# Altium project Phone_Charger.PrjPcb (part 3 of 3)

## Sheet DCDC_Conv_Section.SchDoc
size A4; DocumentNumber: 5; SheetNumber: 5; SheetTotal: 8
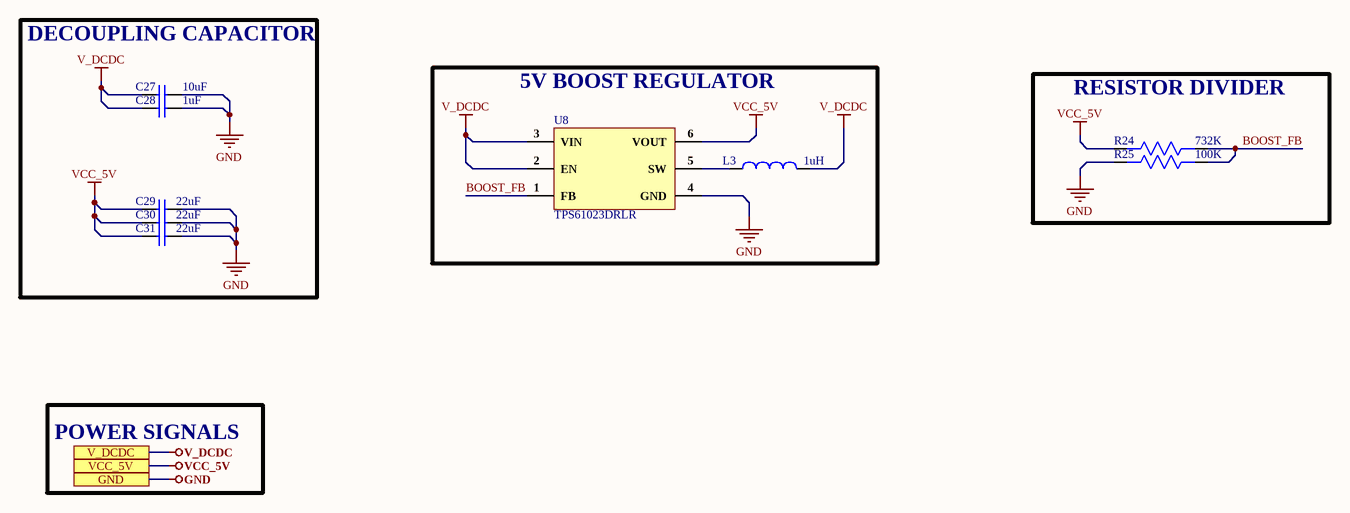
[diagram p6: DCDC_Conv_Section.SchDoc]

### Parts
C27  10uF  [Cap0603]
C28  1uF  [Cap0603]
C29  22uF  [Cap0805]
C30  22uF  [Cap0805]
C31  22uF  [Cap0805]
L3  1uH  [1239AS-H-1R0M=P2]
R24  732K  [Res0603]
R25  100K  [Res0603]
U8  TPS61023DRLR  [TPS61023DRLR]

### Blocks framed on the sheet
DECOUPLING CAPACITOR: C27-C31
5V BOOST REGULATOR: L3 U8
RESISTOR DIVIDER: R24 R25

### Ports
GND, V_DCDC, VCC_5V

### Nets
GND: C27.2 C28.2 C29.2 C30.2 C31.2 R25.2 U8.4(GND) ; port GND
V_DCDC: C27.1 C28.1 L3.2 U8.2(EN) U8.3(VIN) ; port V_DCDC
VCC_5V: C29.1 C30.1 C31.1 R24.2 U8.6(VOUT) ; port VCC_5V
BOOST_FB: R24.1 R25.1 U8.1(FB)
NetL3_1: L3.1 U8.5(SW)

### Notes on the sheet
- POWER SIGNALS

### Library data of the parts
C27 = CC0603MRX5R8BB106: CAP CER 10UF 25V X5R 0603; Manufacturer: Yageo; Tolerance: 20%; ComponentLink1URL: http://www.yageo.com/documents/recent/UPY-GPHC_Y5V_6.3V-to-50V_8.pdf?src-supplier=Digi-Key; ComponentLink1Description: http://www.yageo.com/documents/recent/UPY-GPHC_Y5V_6.3V-to-50V_8.pdf?src-supplier=Digi-Key; ComponentLink2URL: http://www.yageo.com/documents/recent/UPY-GPHC_Y5V_6.3V-to-50V_5.pdf?src-supplier=Avnet+Europe; ComponentLink2Description: http://www.yageo.com/documents/recent/UPY-GPHC_Y5V_6.3V-to-50V_5.pdf?src-supplier=Avnet+Europe; ComponentLink3URL: https://www.verical.com/server-webapp/html/getDatasheet?partID=403611&src-supplier=Verical; ComponentLink3Description: https://www.verical.com/server-webapp/html/getDatasheet?partID=403611&src-supplier=Verical; ComponentLink4URL: http://www.mouser.com/ds/2/447/Yageo_UPY-GP_NP0_16V-to-50V_9-358835.pdf?src-supplier=Mouser; ComponentLink4Description: http://www.mouser.com/ds/2/447/Yageo_UPY-GP_NP0_16V-to-50V_9-358835.pdf?src-supplier=Mouser; ComponentLink5URL: http://www.farnell.com/datasheets/1132289.pdf?src-supplier=Element14; ComponentLink5Description: http://www.farnell.com/datasheets/1132289.pdf?src-supplier=Element14; Supplier 1: Digi-Key; Manufacturer Part Number: CC0603MRX5R8BB106; Stock 1: 0; Pricing 1: 1=0.77, 10=0.568, 50=0.4542, 100=0.3893, 500=0.3082, 1000=0.2595 (USD); Mount: Surface Mount; Case/Package: 0603; Case Code (Imperial): 0603; Case Code (Metric): 1608; Min Operating Temperature: -55°C; Max Operating Temperature: 85°C; Packaging: Cut Tape; Capacitance: 10uF; Voltage Rating: 25V; RoHS Compliant: Yes; ComponentLink6URL: https://www.yageo.com/upload/media/product/productsearch/datasheet/mlcc/UPY-GPHC_X5R_4V-to-50V_26.pdf?src-supplier=Digi-Key; ComponentLink6Description: https://www.yageo.com/upload/media/product/productsearch/datasheet/mlcc/UPY-GPHC_X5R_4V-to-50V_26.pdf?src-supplier=Digi-Key; Supplier Part Number 1: 311-3494-6-ND
C28 = CC0603ZRY5V8BB105: CAP CER 1UF 25V Y5V 0603; Manufacturer: Yageo; Tolerance: 80%; ComponentLink1URL: http://www.yageo.com/documents/recent/UPY-GPHC_Y5V_6.3V-to-50V_8.pdf?src-supplier=Digi-Key; ComponentLink1Description: http://www.yageo.com/documents/recent/UPY-GPHC_Y5V_6.3V-to-50V_8.pdf?src-supplier=Digi-Key; ComponentLink2URL: http://www.yageo.com/documents/recent/UPY-GPHC_Y5V_6.3V-to-50V_5.pdf?src-supplier=Avnet+Europe; ComponentLink2Description: http://www.yageo.com/documents/recent/UPY-GPHC_Y5V_6.3V-to-50V_5.pdf?src-supplier=Avnet+Europe; ComponentLink3URL: https://www.verical.com/server-webapp/html/getDatasheet?partID=403611&src-supplier=Verical; ComponentLink3Description: https://www.verical.com/server-webapp/html/getDatasheet?partID=403611&src-supplier=Verical; ComponentLink4URL: http://www.mouser.com/ds/2/447/Yageo_UPY-GP_NP0_16V-to-50V_9-358835.pdf?src-supplier=Mouser; ComponentLink4Description: http://www.mouser.com/ds/2/447/Yageo_UPY-GP_NP0_16V-to-50V_9-358835.pdf?src-supplier=Mouser; ComponentLink5URL: http://www.farnell.com/datasheets/1132289.pdf?src-supplier=Element14; ComponentLink5Description: http://www.farnell.com/datasheets/1132289.pdf?src-supplier=Element14; Supplier 1: Digi-Key; Manufacturer Part Number: CC0603ZRY5V8BB105; Stock 1: 82432; Pricing 1: 1=0.13, 10=0.096, 50=0.0544, 100=0.045, 500=0.0316, 1000=0.0261 (USD); Mount: Surface Mount; Case/Package: 0603; Case Code (Imperial): 0603; Case Code (Metric): 1608; Min Operating Temperature: -30°C; Max Operating Temperature: 85°C; Voltage Rating (DC): 25V; Packaging: Tape and Reel; Capacitance: 1uF; Voltage Rating: 25V; Dielectric: Y5V; Termination: SMD/SMT; Resistor Type: Ceramic; Series: CC; Length: 0.063inch; Width: 0.031inch; Height: 0.8mm; Thickness: 0.035inch; Lead Free: Lead Free; Halogen Free: Halogen Free; RoHS Compliant: Yes; Supplier Part Number 1: 311-1829-1-ND
C29-C31 = C2012X5R1V226MT000E: CAP CER 22UF 35V X5R 0805
L3 = 1239AS-H-1R0M=P2: 3A 1uH ±20% 59mΩ 1008 Inductors (SMD) ROHS
R24 = AC0603FR-07732KL: RES SMD 732kOhm 1% 0603; Manufacturer: Yageo; Power Rating: 100mW; Resistance: 732kR; Voltage Rating: 50V; Temperature Coefficient: 100ppm/°C; Supplier 1: Mouser; Manufacturer Part Number: AC0603FR-07732KL; RoHS: Yes; Category: Chip SMD Resistors; Stock 1: 40000; Pricing 1: 1=0.10000, 10=0.02200, 50=0.02200, 100=0.00800, 1000=0.00600, 10000=0.00400 (USD); Case/Package: 0603; Case Code (Imperial): 0603; Case Code (Metric): 1608; Min Operating Temperature: -55°C; Max Operating Temperature: 155°C; Packaging: Tape and Reel; Tolerance: 1%; Resistor Type: Thick Film; Number of Terminations: 2; Termination: SMD/SMT; Max Power Dissipation: 100mW; Features: Moisture Resistant,Automotive AEC-Q200; Series: AC; Length: 0.063inch; Width: 0.031inch; Height: 0.022inch; RoHS Compliant: Yes; ComponentLink1URL: http://www.mouser.com/ds/2/447/yageodocoutput-1111992.pdf?src-supplier=Mouser; ComponentLink1Description: http://www.mouser.com/ds/2/447/yageodocoutput-1111992.pdf?src-supplier=Mouser; ComponentLink2URL: http://www.yageo.com/NewPortal/yageodocoutput?fileName=/pdf/R-Chip/PYu-AC_51_RoHS_L_6.pdf&src-supplier=Digi-Key; ComponentLink2Description: http://www.yageo.com/NewPortal/yageodocoutput?fileName=/pdf/R-Chip/PYu-AC_51_RoHS_L_6.pdf&src-supplier=Digi-Key; Supplier Part Number 1: 603-AC0603FR-07732KL
R25 = RC0603FR-07100KL: RES SMD 100K OHM 1% 1/10W 0603
U8 = TPS61023DRLR: 3.7-A boost converter with 0.5-V ultra-low input voltage 6-SOT-5X3 -40 to 125; Manufacturer: Texas Instruments; Supplier 1: Digi-Key; Manufacturer Part Number: TPS61023DRLR; RoHS: Yes; Category: Voltage Regulators - Switching; Pricing 1: 1=1.03000, 10=0.91900, 25=0.87240, 100=0.71680, 250=0.67004, 500=0.59212, 1000=0.51450 (USD); Supplier Part Number 1: 296-TPS61023DRLRDKR-ND

## Sheet Lamp_Section.SchDoc
size A4; DocumentNumber: 7; SheetNumber: 7; SheetTotal: 8
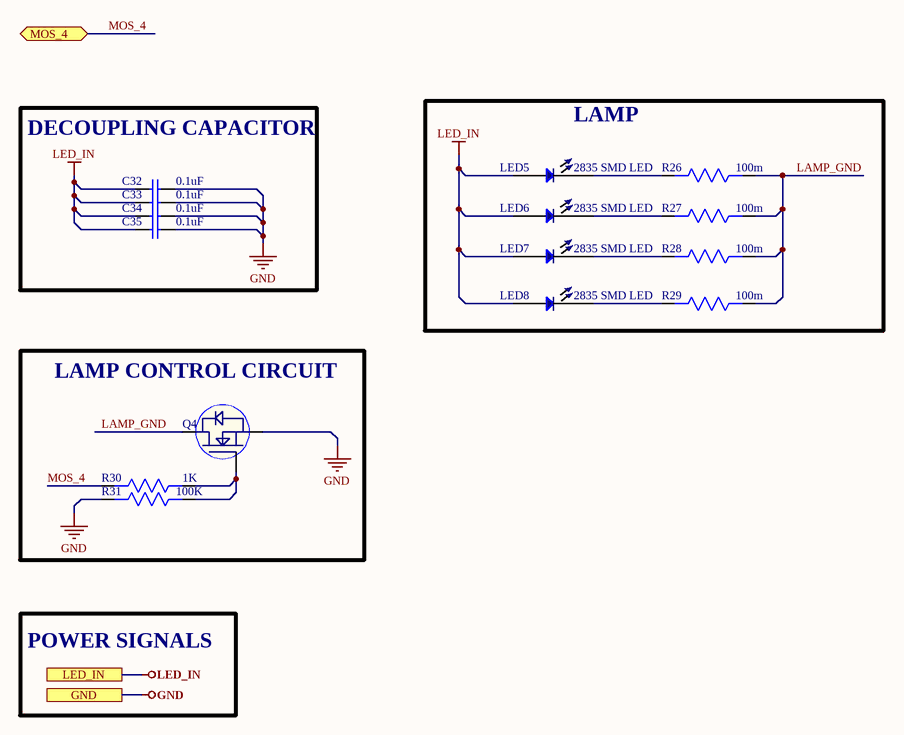
[diagram p7: Lamp_Section.SchDoc]

### Parts
C32  0.1uF  [Cap0603]
C33  0.1uF  [Cap0603]
C34  0.1uF  [Cap0603]
C35  0.1uF  [Cap0603]
LED5  2835 SMD LED  [2835 LED]
LED6  2835 SMD LED  [2835 LED]
LED7  2835 SMD LED  [2835 LED]
LED8  2835 SMD LED  [2835 LED]
Q4  DMN1045UFR4-7  [DMN1045UFR4-7]  (value not drawn)
R26  100m  [Res-1206]
R27  100m  [Res-1206]
R28  100m  [Res-1206]
R29  100m  [Res-1206]
R30  1K  [Res0603]
R31  100K  [Res0603]

### Blocks framed on the sheet
DECOUPLING CAPACITOR: C32-C35
LAMP: LED5-LED8 R26-R29
LAMP CONTROL CIRCUIT: Q4 R30 R31

### Ports
GND, LED_IN, MOS_4 (bidir)

### Nets
GND: C32.2 C33.2 C34.2 C35.2 Q4.2(S) R31.2 ; port GND
LED_IN: C32.1 C33.1 C34.1 C35.1 LED5.1 LED6.1 LED7.1 LED8.1 ; port LED_IN
LAMP_GND: Q4.3(D) R26.1 R27.1 R28.1 R29.1
MOS_4: R30.2 ; port MOS_4
NetLED5_2: LED5.2 R26.2
NetLED6_2: LED6.2 R27.2
NetLED7_2: LED7.2 R28.2
NetLED8_2: LED8.2 R29.2
NetQ4_1: Q4.1(G) R30.1 R31.1

### Notes on the sheet
- POWER SIGNALS

### Library data of the parts
C32-C35 = CC0603ZRY5V9BB104: CAP CER 0.1UF 50V Y5V 0603; Manufacturer: Yageo; Capacitance: 100nF; Tolerance: 80%; Supplier 1: Digi-Key; Manufacturer Part Number: CC0603ZRY5V9BB104; Stock 1: 15000880; Pricing 1: 1=0.1, 10=0.075, 100=0.0334, 500=0.02386, 1000=0.01874 (USD); Mount: Surface Mount; Case/Package: 0603; Number of Pins: 2; Case Code (Metric): 1608; Case Code (Imperial): 0603; Min Operating Temperature: -30°C; Max Operating Temperature: 85°C; Dielectric: Y5V; Voltage Rating: 50V; Package Quantity: 1; Packaging: Tape and Reel; Voltage Rating (DC): 50V; Termination: SMD/SMT; Composition: Ceramic; Voltage: 50V; Length: 1.6mm; Height: 0.8mm; Width: 0.031inch; Thickness: 0.035inch; Depth: 0.8mm; Radiation Hardening: No; REACH SVHC: No SVHC; Lead Free: Lead Free; Halogen Free: Halogen Free; ComponentLink1URL: http://www.yageo.com/documents/recent/UPY-GPHC_Y5V_6.3V-to-50V_8.pdf?src-supplier=Digi-Key; ComponentLink1Description: http://www.yageo.com/documents/recent/UPY-GPHC_Y5V_6.3V-to-50V_8.pdf?src-supplier=Digi-Key; ComponentLink2URL: http://www.yageo.com/documents/recent/UPY-GPHC_Y5V_6.3V-to-50V_5.pdf?src-supplier=Avnet+Europe; ComponentLink2Description: http://www.yageo.com/documents/recent/UPY-GPHC_Y5V_6.3V-to-50V_5.pdf?src-supplier=Avnet+Europe; ComponentLink3URL: https://www.verical.com/server-webapp/html/getDatasheet?partID=403611&src-supplier=Verical; ComponentLink3Description: https://www.verical.com/server-webapp/html/getDatasheet?partID=403611&src-supplier=Verical; ComponentLink4URL: http://www.mouser.com/ds/2/447/Yageo_UPY-GP_NP0_16V-to-50V_9-358835.pdf?src-supplier=Mouser; ComponentLink4Description: http://www.mouser.com/ds/2/447/Yageo_UPY-GP_NP0_16V-to-50V_9-358835.pdf?src-supplier=Mouser; ComponentLink5URL: http://www.farnell.com/datasheets/1132289.pdf?src-supplier=Element14; ComponentLink5Description: http://www.farnell.com/datasheets/1132289.pdf?src-supplier=Element14; Supplier Part Number 1: 311-1343-1-ND
LED5-LED8 = 2835 SMD LED: SMD LED 2835 Chips 1W 3V SMD; Manufacturer: ENLINCA; Max. Forward voltage: 3V; Package: 2835
Q4 = DMN1045UFR4-7: Mosfet N-ch 12V 3.2A 3-PIN X2-DFN T/r; Manufacturer: Diodes; Rds On Max: 45mR; Input Capacitance: 375pF; Max Power Dissipation: 500mW; Supplier 1: Digi-Key; Manufacturer Part Number: DMN1045UFR4-7; RoHS: Yes; Category: MOSFETs; Pricing 1: 1=0.50000, 10=0.37400, 100=0.23280, 500=0.15930, 1000=0.12254 (USD); Mount: Surface Mount; Number of Pins: 3; Min Operating Temperature: -55°C; Max Operating Temperature: 150°C; Packaging: Tape and Reel; Drain to Source Voltage (Vdss): 12V; Continuous Drain Current (ID): 3.2A; RoHS Compliant: Yes; ComponentLink1URL: http://www.mouser.com/ds/2/115/DMN1045UFR4-526244.pdf?src-supplier=Mouser; ComponentLink1Description: http://www.mouser.com/ds/2/115/DMN1045UFR4-526244.pdf?src-supplier=Mouser; ComponentLink2URL: https://www.diodes.com/assets/Datasheets/DMN1045UFR4.pdf?src-supplier=Digi-Key; ComponentLink2Description: https://www.diodes.com/assets/Datasheets/DMN1045UFR4.pdf?src-supplier=Digi-Key; Supplier Part Number 1: DMN1045UFR4-7DIDKR-ND
R26-R29 = ERJ8BWFR100V: RES SMD 1206 0.1 Ohm 1% 1W ±100ppm/°C; Manufacturer: Panasonic; Manufacturer Part Number: ERJ-8BWFR100V; Resistance: 100mR; Supplier 1: Digi-Key; RoHS: Yes; Category: Chip SMD Resistors; Stock 1: 71395; Pricing 1: 1=0.86000, 10=0.63400, 100=0.36940, 1000=0.20719, 2500=0.20002 (USD); Mount: Surface Mount; Case/Package: 1206; Number of Pins: 2; Contact Plating: Tin; Case Code (Metric): 3216; Case Code (Imperial): 1206; Size Code: 1206; Min Operating Temperature: -55°C; Max Operating Temperature: 155°C; Tolerance: 1%; Resistor Type: Thick Film,Low-Ohm-Resistor; Temperature Coefficient: 100ppm/°C; Power Rating: 1W; Packaging: Tape and Reel; Package Quantity: 1; Number of Terminations: 2; Termination: SMD/SMT; Max Power Dissipation: 1W; Features: Automotive AEC-Q200; Series: ERJ; Technology: THICK FILM; Resistance Tolerance: 1%; Construction: Rectangular; Length: 3.2mm; Width: 0.063inch; Height: 0.65mm; Depth: 1.6mm; Radiation Hardening: No; REACH SVHC: No SVHC; Military Standard: Not; Lead Free: Lead Free; RoHS Compliant: Yes; ComponentLink1URL: https://datasheet.ciiva.com/11812/0900766b8126441d-11812516.pdf?src-supplier=RSComponents; ComponentLink1Description: https://datasheet.ciiva.com/11812/0900766b8126441d-11812516.pdf?src-supplier=RSComponents; ComponentLink2URL: https://datasheet.ciiva.com/16212/erj-8bwfr100v-16212037.pdf?src-supplier=Future+Electronics; ComponentLink2Description: https://datasheet.ciiva.com/16212/erj-8bwfr100v-16212037.pdf?src-supplier=Future+Electronics; ComponentLink3URL: https://datasheet.ciiva.com/24072/aoa0000ce3-72189-24072813.pdf?src-supplier=Mouser; ComponentLink3Description: https://datasheet.ciiva.com/24072/aoa0000ce3-72189-24072813.pdf?src-supplier=Mouser; ComponentLink4URL: https://datasheet.ciiva.com/2451/aoa0000ce3-2451533.pdf?src-supplier=Digi-Key; ComponentLink4Description: https://datasheet.ciiva.com/2451/aoa0000ce3-2451533.pdf?src-supplier=Digi-Key; ComponentLink5URL: https://datasheet.ciiva.com/17208/aoa0000ce3-17208060.pdf?src-supplier=Avnet+Europe; ComponentLink5Description: https://datasheet.ciiva.com/17208/aoa0000ce3-17208060.pdf?src-supplier=Avnet+Europe; ComponentLink6URL: https://datasheet.ciiva.com/2451/aoa0000ce3-2451532.pdf?src-supplier=Digi-Key; ComponentLink6Description: https://datasheet.ciiva.com/2451/aoa0000ce3-2451532.pdf?src-supplier=Digi-Key; ComponentLink7URL: https://datasheet.ciiva.com/46386/1662788-46386715.pdf?src-supplier=Element14; ComponentLink7Description: https://datasheet.ciiva.com/46386/1662788-46386715.pdf?src-supplier=Element14; ComponentLink8URL: https://datasheet.ciiva.com/6137/1662788-6137674.pdf?src-supplier=Farnell; ComponentLink8Description: https://datasheet.ciiva.com/6137/1662788-6137674.pdf?src-supplier=Farnell; ComponentLink9URL: https://datasheet.ciiva.com/43455/1662788-43455193.pdf?src-supplier=Farnell; ComponentLink9Description: https://datasheet.ciiva.com/43455/1662788-43455193.pdf?src-supplier=Farnell; ComponentLink10URL: https://datasheet.ciiva.com/16787/70068852-16787433.pdf?src-supplier=Allied+Electronics; ComponentLink10Description: https://datasheet.ciiva.com/16787/70068852-16787433.pdf?src-supplier=Allied+Electronics; ComponentLink11URL: https://datasheet.ciiva.com/28667/39793-28667735.pdf?src-supplier=Element14; ComponentLink11Description: https://datasheet.ciiva.com/28667/39793-28667735.pdf?src-supplier=Element14; ComponentLink12URL: https://datasheet.ciiva.com/48516/erj-eng-tds-48516677.pdf?src-supplier=Distrelec; ComponentLink12Description: https://datasheet.ciiva.com/48516/erj-eng-tds-48516677.pdf?src-supplier=Distrelec; ComponentLink13URL: https://datasheet.ciiva.com/30092/6aoa0000ce3-30092213.pdf?src-supplier=Onlinecomponents.com; ComponentLink13Description: https://datasheet.ciiva.com/30092/6aoa0000ce3-30092213.pdf?src-supplier=Onlinecomponents.com; ComponentLink14URL: https://datasheet.ciiva.com/16783/70068852-16783653.pdf?src-supplier=Allied+Electronics; ComponentLink14Description: https://datasheet.ciiva.com/16783/70068852-16783653.pdf?src-supplier=Allied+Electronics; ComponentLink15URL: https://datasheet.ciiva.com/16780/70068852-16780101.pdf?src-supplier=Allied+Electronics; ComponentLink15Description: https://datasheet.ciiva.com/16780/70068852-16780101.pdf?src-supplier=Allied+Electronics; ComponentLink16URL: https://datasheet.ciiva.com/2451/aoa0000ce3-2451534.pdf?src-supplier=Digi-Key; ComponentLink16Description: https://datasheet.ciiva.com/2451/aoa0000ce3-2451534.pdf?src-supplier=Digi-Key; ComponentLink17URL: https://datasheet.ciiva.com/16516/aoa0000ce3-16516495.pdf?src-supplier=Avnet+Asia; ComponentLink17Description: https://datasheet.ciiva.com/16516/aoa0000ce3-16516495.pdf?src-supplier=Avnet+Asia; Supplier Part Number 1: P.10AUCT-ND
R30 = RC0603FR-071KL: RES SMD 1K OHM 1% 1/10W 0603; Manufacturer: Yageo; Resistance: 1kR; Temperature Coefficient: 100ppm/°C; Power Rating: 100mW; Voltage Rating: 50V; ComponentLink1URL: https://www.verical.com/server-webapp/html/getDatasheet?partID=409289&src-supplier=Verical; ComponentLink1Description: https://www.verical.com/server-webapp/html/getDatasheet?partID=409289&src-supplier=Verical; Supplier 1: Digi-Key; Manufacturer Part Number: RC0603FR-071KL; Stock 1: 21472395; Pricing 1: 1=0.1, 10=0.023, 100=0.0094, 1000=0.0042, 2500=0.0037 (USD); Case/Package: 0603; Contact Plating: Tin,Matte; Case Code (Imperial): 0603; Case Code (Metric): 1608; Min Operating Temperature: -55°C; Max Operating Temperature: 155°C; Tolerance: 1%; Composition: Thick Film; Packaging: Tape and Reel; Termination: SMD/SMT; Military Standard: Not; Length: 1.6mm; Height: 0.45mm; Depth: 0.8mm; Radiation Hardening: No; REACH SVHC: No SVHC; Lead Free: Lead Free; ComponentLink2URL: http://documents.rs-components.com/techlib://itc_doclist_GB.htm?stockno=5048928&src-supplier=RSComponents; ComponentLink2Description: http://documents.rs-components.com/techlib://itc_doclist_GB.htm?stockno=5048928&src-supplier=RSComponents; ComponentLink3URL: http://www.yageo.com/documents/recent/PYu-RC0603_51_RoHS_L_4.pdf?src-supplier=Avnet+Europe; ComponentLink3Description: http://www.yageo.com/documents/recent/PYu-RC0603_51_RoHS_L_4.pdf?src-supplier=Avnet+Europe; ComponentLink4URL: http://www.farnell.com/datasheets/2167052.pdf?src-supplier=Element14; ComponentLink4Description: http://www.farnell.com/datasheets/2167052.pdf?src-supplier=Element14; ComponentLink5URL: http://www.farnell.com/datasheets/1868787.pdf?src-supplier=Element14; ComponentLink5Description: http://www.farnell.com/datasheets/1868787.pdf?src-supplier=Element14; ComponentLink6URL: http://www.yageo.com/documents/recent/PYu-RC_Group_51_RoHS_L_2.pdf?src-supplier=Avnet; ComponentLink6Description: http://www.yageo.com/documents/recent/PYu-RC_Group_51_RoHS_L_2.pdf?src-supplier=Avnet; ComponentLink7URL: https://www.verical.com/server-webapp/html/getDatasheet?partID=404327&src-supplier=Verical; ComponentLink7Description: https://www.verical.com/server-webapp/html/getDatasheet?partID=404327&src-supplier=Verical; ComponentLink8URL: http://www.farnell.com/datasheets/443971.pdf?src-supplier=Element14; ComponentLink8Description: http://www.farnell.com/datasheets/443971.pdf?src-supplier=Element14; Supplier Part Number 1: 311-1.00KHRDKR-ND
R31 = RC0603FR-07100KL: RES SMD 100K OHM 1% 1/10W 0603

## Sheet USB_Section.SchDoc
size A4; DocumentNumber: 8; SheetNumber: 8; SheetTotal: 8
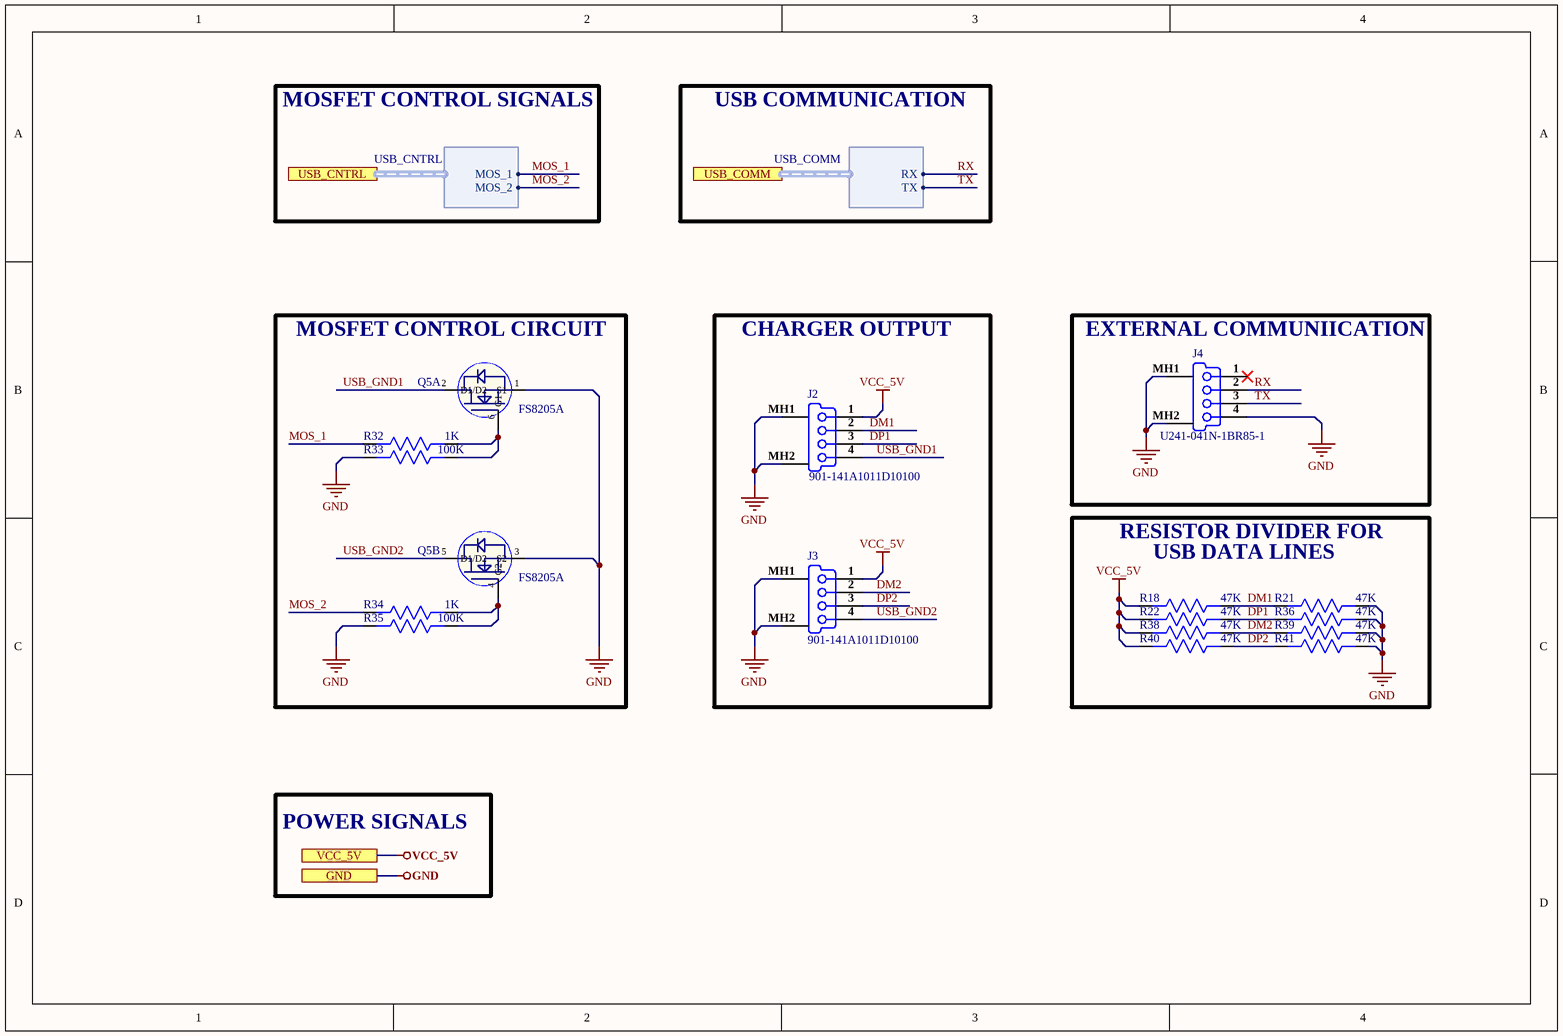
[diagram p8: USB_Section.SchDoc]

### Parts
J2  901-141A1011D10100  [901-141A1011D10100]
J3  901-141A1011D10100  [901-141A1011D10100]
J4  U241-041N-1BR85-1  [U241-041N-1BR85-1]
Q5  FS8205A  [SOT-23-6]  (parts A,B of 2)
R18  47K  [Res0603]
R21  47K  [Res0603]
R22  47K  [Res0603]
R32  1K  [Res0603]
R33  100K  [Res0603]
R34  1K  [Res0603]
R35  100K  [Res0603]
R36  47K  [Res0603]
R38  47K  [Res0603]
R39  47K  [Res0603]
R40  47K  [Res0603]
R41  47K  [Res0603]

### Blocks framed on the sheet
MOSFET CONTROL CIRCUIT: Q5 R32-R35
CHARGER OUTPUT: J2 J3
EXTERNAL COMMUNIICATION: J4

### Ports
GND, USB_CNTRL (harness USB_CNTRL), USB_COMM (harness USB_COMM), VCC_5V

### Harnesses
USB_CNTRL: MOS_1, MOS_2
USB_COMM: RX, TX

### Nets
GND: J2.MH1(Tab) J2.MH2(Tab) J3.MH1(Tab) J3.MH2(Tab) J4.4(GND) J4.MH1(Tab) J4.MH2(Tab) Q5.1(S1) Q5.3(S2) R21.1 R33.2 R35.2 R36.1 R39.1 R41.1 ; port GND
VCC_5V: J2.1(V_BUS_(5V)) J3.1(V_BUS_(5V)) R18.2 R22.2 R38.2 R40.2 ; port VCC_5V
DM1: J2.2(D-) R18.1 R21.2
DM2: J3.2(D-) R38.1 R39.2
DP1: J2.3(D+) R22.1 R36.2
DP2: J3.3(D+) R40.1 R41.2
MOS_1: R32.2 ; port USB_CNTRL.MOS_1
MOS_2: R34.2 ; port USB_CNTRL.MOS_2
RX: J4.2(D-) ; port USB_COMM.RX
TX: J4.3(D+) ; port USB_COMM.TX
USB_GND1: J2.4(GND) Q5.2(D1/D2)
USB_GND2: J3.4(GND) Q5.5(D1/D2)
NetQ5_4: Q5.4(G2) R34.1 R35.1
NetQ5_6: Q5.6(G1) R32.1 R33.1

Not connected (* = marked no-connect by the designer): J4 1(V_BUS_(5V))*

### Notes on the sheet
- MOSFET CONTROL SIGNALS
- USB COMMUNICATION
- RESISTOR DIVIDER FOR
- USB DATA LINES
- POWER SIGNALS

### Library data of the parts
J2 J3 = 901-141A1011D10100: USB - Type A 4 USB 2.0 Female THT; Manufacturer: Jing Extension of the Electronic Co.; Current Rating: 1.5A; Number of Ports: 1; Number of Contacts: 4; Mounting Type: ThroughHole，RightAngle; Connector Type: USB - Type A; Standard: USB 2.0; Gender: Female
J4 = U241-041N-1BR85-1: USB - Type B 4 USB 2.0 Female Through Hole; Manufacturer: XKB Connectivity; Current Rating: 2A; Number of Ports: 1; Number of Contacts: 4; Mounting Type: ThroughHole，RightAngle; Connector Type: USB - Type B; Standard: USB 2.0; Gender: Female
Q5 = FS8205A: 2 N-Channel 466pF 10V 5.7nC 10V +150℃ (Tj) SOT23-6 MOSFETs; Manufacturer: TECH; Value: Custom; Manufacturer Part No: FS8205A; Package: SOT23-6; ComponentLink1Description: LCSC; ComponentLink1URL: https://lcsc.com/product-detail/MOSFETs_TECH-PUBLIC-FS8205A_C2830320.html
R18 R21 R22 R36 R38-R41 = ERJP03F4702V: RES SMD 47K Ohm 1% 0.2W(1/5W) 0603; Manufacturer: Panasonic; Manufacturer Part Number: ERJ-P03F4702V; Resistance: 47kR; Temperature Coefficient: 200ppm/°C; Power Rating: 200mW; Voltage Rating: 150V; Supplier 1: Digi-Key; RoHS: Yes; Category: Chip SMD Resistors; Stock 1: 5635; Pricing 1: 1=0.37000, 10=0.31600, 100=0.12360, 1000=0.05175, 2500=0.04744 (USD); Mount: Surface Mount; Case/Package: 0603; Number of Pins: 2; Contact Plating: Tin; Case Code (Imperial): 0603; Case Code (Metric): 1608; Min Operating Temperature: -55°C; Max Operating Temperature: 155°C; Tolerance: 1%; Resistor Type: Thick Film; Packaging: Tape and Reel; Package Quantity: 5000; Termination: SMD/SMT; Voltage Rating (DC): 150V; Length: 1.6mm; Width: 0.8mm; Height: 0.45mm; Depth: 0.8mm; Radiation Hardening: No; REACH SVHC: No SVHC; Military Standard: Not; RoHS Compliant: Yes; ComponentLink1URL: https://datasheet.ciiva.com/11817/0900766b812cb812-11817157.pdf?src-supplier=RSComponents; ComponentLink1Description: https://datasheet.ciiva.com/11817/0900766b812cb812-11817157.pdf?src-supplier=RSComponents; ComponentLink2URL: https://datasheet.ciiva.com/48537/erjp-series-eng-tds-48537294.pdf?src-supplier=Distrelec; ComponentLink2Description: https://datasheet.ciiva.com/48537/erjp-series-eng-tds-48537294.pdf?src-supplier=Distrelec; ComponentLink3URL: https://datasheet.ciiva.com/6138/1801181-6138332.pdf?src-supplier=Farnell; ComponentLink3Description: https://datasheet.ciiva.com/6138/1801181-6138332.pdf?src-supplier=Farnell; ComponentLink4URL: https://datasheet.ciiva.com/7802/1790600-7802523.pdf?src-supplier=Element14; ComponentLink4Description: https://datasheet.ciiva.com/7802/1790600-7802523.pdf?src-supplier=Element14; ComponentLink5URL: https://datasheet.ciiva.com/7802/1790600-7802522.pdf?src-supplier=Element14; ComponentLink5Description: https://datasheet.ciiva.com/7802/1790600-7802522.pdf?src-supplier=Element14; ComponentLink6URL: https://datasheet.ciiva.com/22730/1790600-22730106.pdf?src-supplier=Element14; ComponentLink6Description: https://datasheet.ciiva.com/22730/1790600-22730106.pdf?src-supplier=Element14; ComponentLink7URL: https://datasheet.ciiva.com/28681/1790600-28681575.pdf?src-supplier=Element14; ComponentLink7Description: https://datasheet.ciiva.com/28681/1790600-28681575.pdf?src-supplier=Element14; ComponentLink8URL: https://datasheet.ciiva.com/24072/aoa0000ce4-64075-24072175.pdf?src-supplier=Mouser; ComponentLink8Description: https://datasheet.ciiva.com/24072/aoa0000ce4-64075-24072175.pdf?src-supplier=Mouser; Supplier Part Number 1: P16027CT-ND
R32 R34 = RC0603FR-071KL: as R30 on sheet Lamp_Section; ComponentLink1URL: https://www.verical.com/server-webapp/html/getDatasheet?partID=409289&src-supplier=Verical; ComponentLink1Description: https://www.verical.com/server-webapp/html/getDatasheet?partID=409289&src-supplier=Verical; Supplier 1: Digi-Key; Manufacturer Part Number: RC0603FR-071KL; Stock 1: 21472395; Pricing 1: 1=0.1, 10=0.023, 100=0.0094, 1000=0.0042, 2500=0.0037 (USD); Case/Package: 0603; Contact Plating: Tin,Matte; Case Code (Imperial): 0603; Case Code (Metric): 1608; Min Operating Temperature: -55°C; Max Operating Temperature: 155°C; Tolerance: 1%; Composition: Thick Film; Packaging: Tape and Reel; Termination: SMD/SMT; Military Standard: Not; Length: 1.6mm; Height: 0.45mm; Depth: 0.8mm; Radiation Hardening: No; REACH SVHC: No SVHC; Lead Free: Lead Free; ComponentLink2URL: http://documents.rs-components.com/techlib://itc_doclist_GB.htm?stockno=5048928&src-supplier=RSComponents; ComponentLink2Description: http://documents.rs-components.com/techlib://itc_doclist_GB.htm?stockno=5048928&src-supplier=RSComponents; ComponentLink3URL: http://www.yageo.com/documents/recent/PYu-RC0603_51_RoHS_L_4.pdf?src-supplier=Avnet+Europe; ComponentLink3Description: http://www.yageo.com/documents/recent/PYu-RC0603_51_RoHS_L_4.pdf?src-supplier=Avnet+Europe; ComponentLink4URL: http://www.farnell.com/datasheets/2167052.pdf?src-supplier=Element14; ComponentLink4Description: http://www.farnell.com/datasheets/2167052.pdf?src-supplier=Element14; ComponentLink5URL: http://www.farnell.com/datasheets/1868787.pdf?src-supplier=Element14; ComponentLink5Description: http://www.farnell.com/datasheets/1868787.pdf?src-supplier=Element14; ComponentLink6URL: http://www.yageo.com/documents/recent/PYu-RC_Group_51_RoHS_L_2.pdf?src-supplier=Avnet; ComponentLink6Description: http://www.yageo.com/documents/recent/PYu-RC_Group_51_RoHS_L_2.pdf?src-supplier=Avnet; ComponentLink7URL: https://www.verical.com/server-webapp/html/getDatasheet?partID=404327&src-supplier=Verical; ComponentLink7Description: https://www.verical.com/server-webapp/html/getDatasheet?partID=404327&src-supplier=Verical; ComponentLink8URL: http://www.farnell.com/datasheets/443971.pdf?src-supplier=Element14; ComponentLink8Description: http://www.farnell.com/datasheets/443971.pdf?src-supplier=Element14; Supplier Part Number 1: 311-1.00KHRDKR-ND
R33 R35 = RC0603FR-07100KL: RES SMD 100K OHM 1% 1/10W 0603

## Nets that join several sheets
CHRG_5V: Battery_Charging_Section (6 pins), Battery_Management_Section (C21.1 U5.2), Connector_Section (C7.1 J1.1), Power_Section (5 pins)
GND: Controller_Section (18 pins), Battery_Charging_Section (11 pins), Battery_Management_Section (9 pins), Connector_Section (9 pins), Power_Section (14 pins), DCDC_Conv_Section (7 pins), Lamp_Section (6 pins), USB_Section (15 pins)
LED_IN: Power_Section (U7.7), Lamp_Section (8 pins)
V_DCDC: Battery_Management_Section (U4.5 U4.6), DCDC_Conv_Section (5 pins)
VBAT: Controller_Section (U1.23), Battery_Charging_Section (C11.1 R4.2 U2.9), Battery_Management_Section (10 pins), Connector_Section (C14.1 R7.2 R9.2), Power_Section (C23.1 C24.1 U6.4 U7.8)
VCC_5V: Controller_Section (8 pins), Connector_Section (P1.2), Power_Section (8 pins), DCDC_Conv_Section (5 pins), USB_Section (6 pins)
A1: Controller_Section (U1.24), Connector_Section (C15.1 R8.1 R9.1)
ADC_A2: Controller_Section (U1.25), Power_Section (U6.1)
D11/MOSI: Controller_Section (R12.2 U1.15), Connector_Section (P1.5)
D12/MISO: Controller_Section (U1.16), Connector_Section (P1.1)
D13/SCK: Controller_Section (U1.17), Connector_Section (P1.3)
IN: Connector_Section (D2.2 P2.1 R7.1), Power_Section (U6.3)
MOS_1: Controller_Section (U1.2), USB_Section (R32.2)
MOS_2: Controller_Section (U1.11), USB_Section (R34.2)
MOS_4: Controller_Section (U1.10), Lamp_Section (R30.2)
NetR1_2: Controller_Section (U1.14), Battery_Charging_Section (R1.2)
RESET: Controller_Section (C9.1 R6.1 SW1.1 U1.29), Connector_Section (P1.4)
RX: Controller_Section (U1.1 U1.30), USB_Section (J4.2)
TX: Controller_Section (U1.31), USB_Section (J4.3)